# Altium schematic sheet eso32schemtic.SchDoc (part 1 of 3)
size A2; SheetNumber: 1; SheetTotal: 1
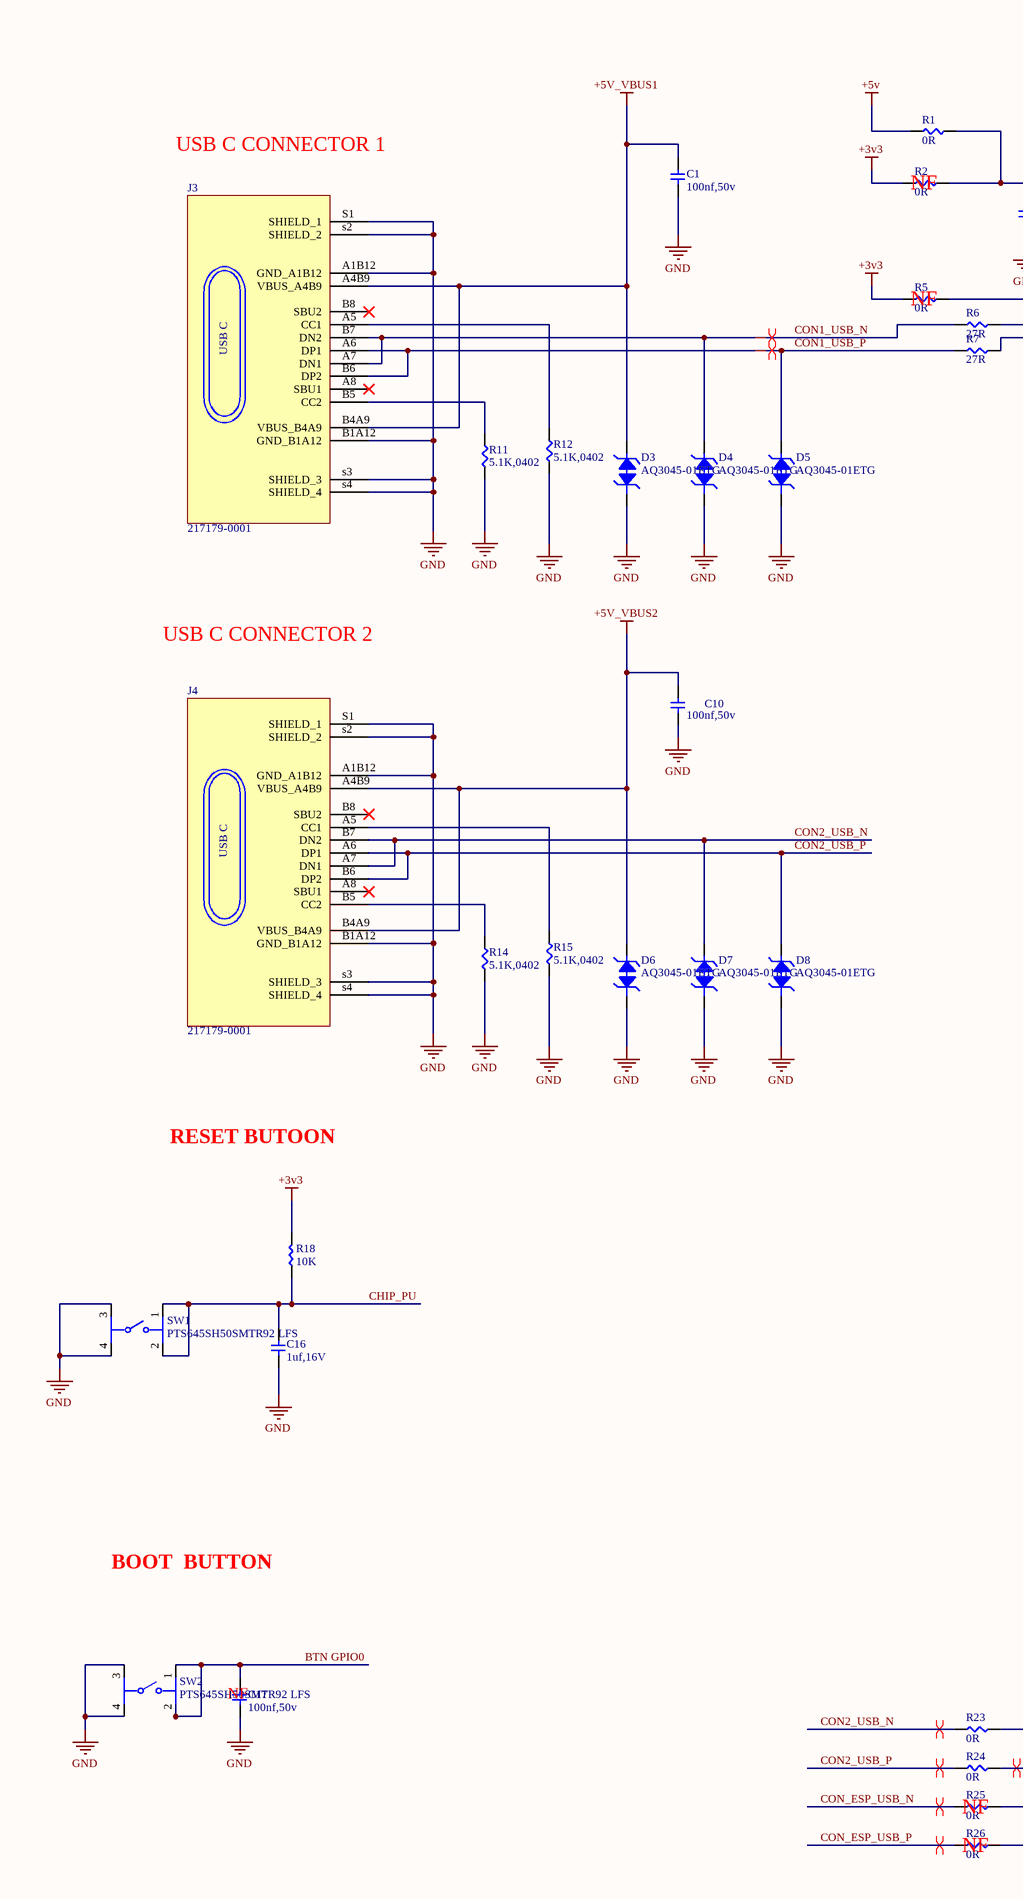
[diagram p0: eso32schemtic.SchDoc, left]
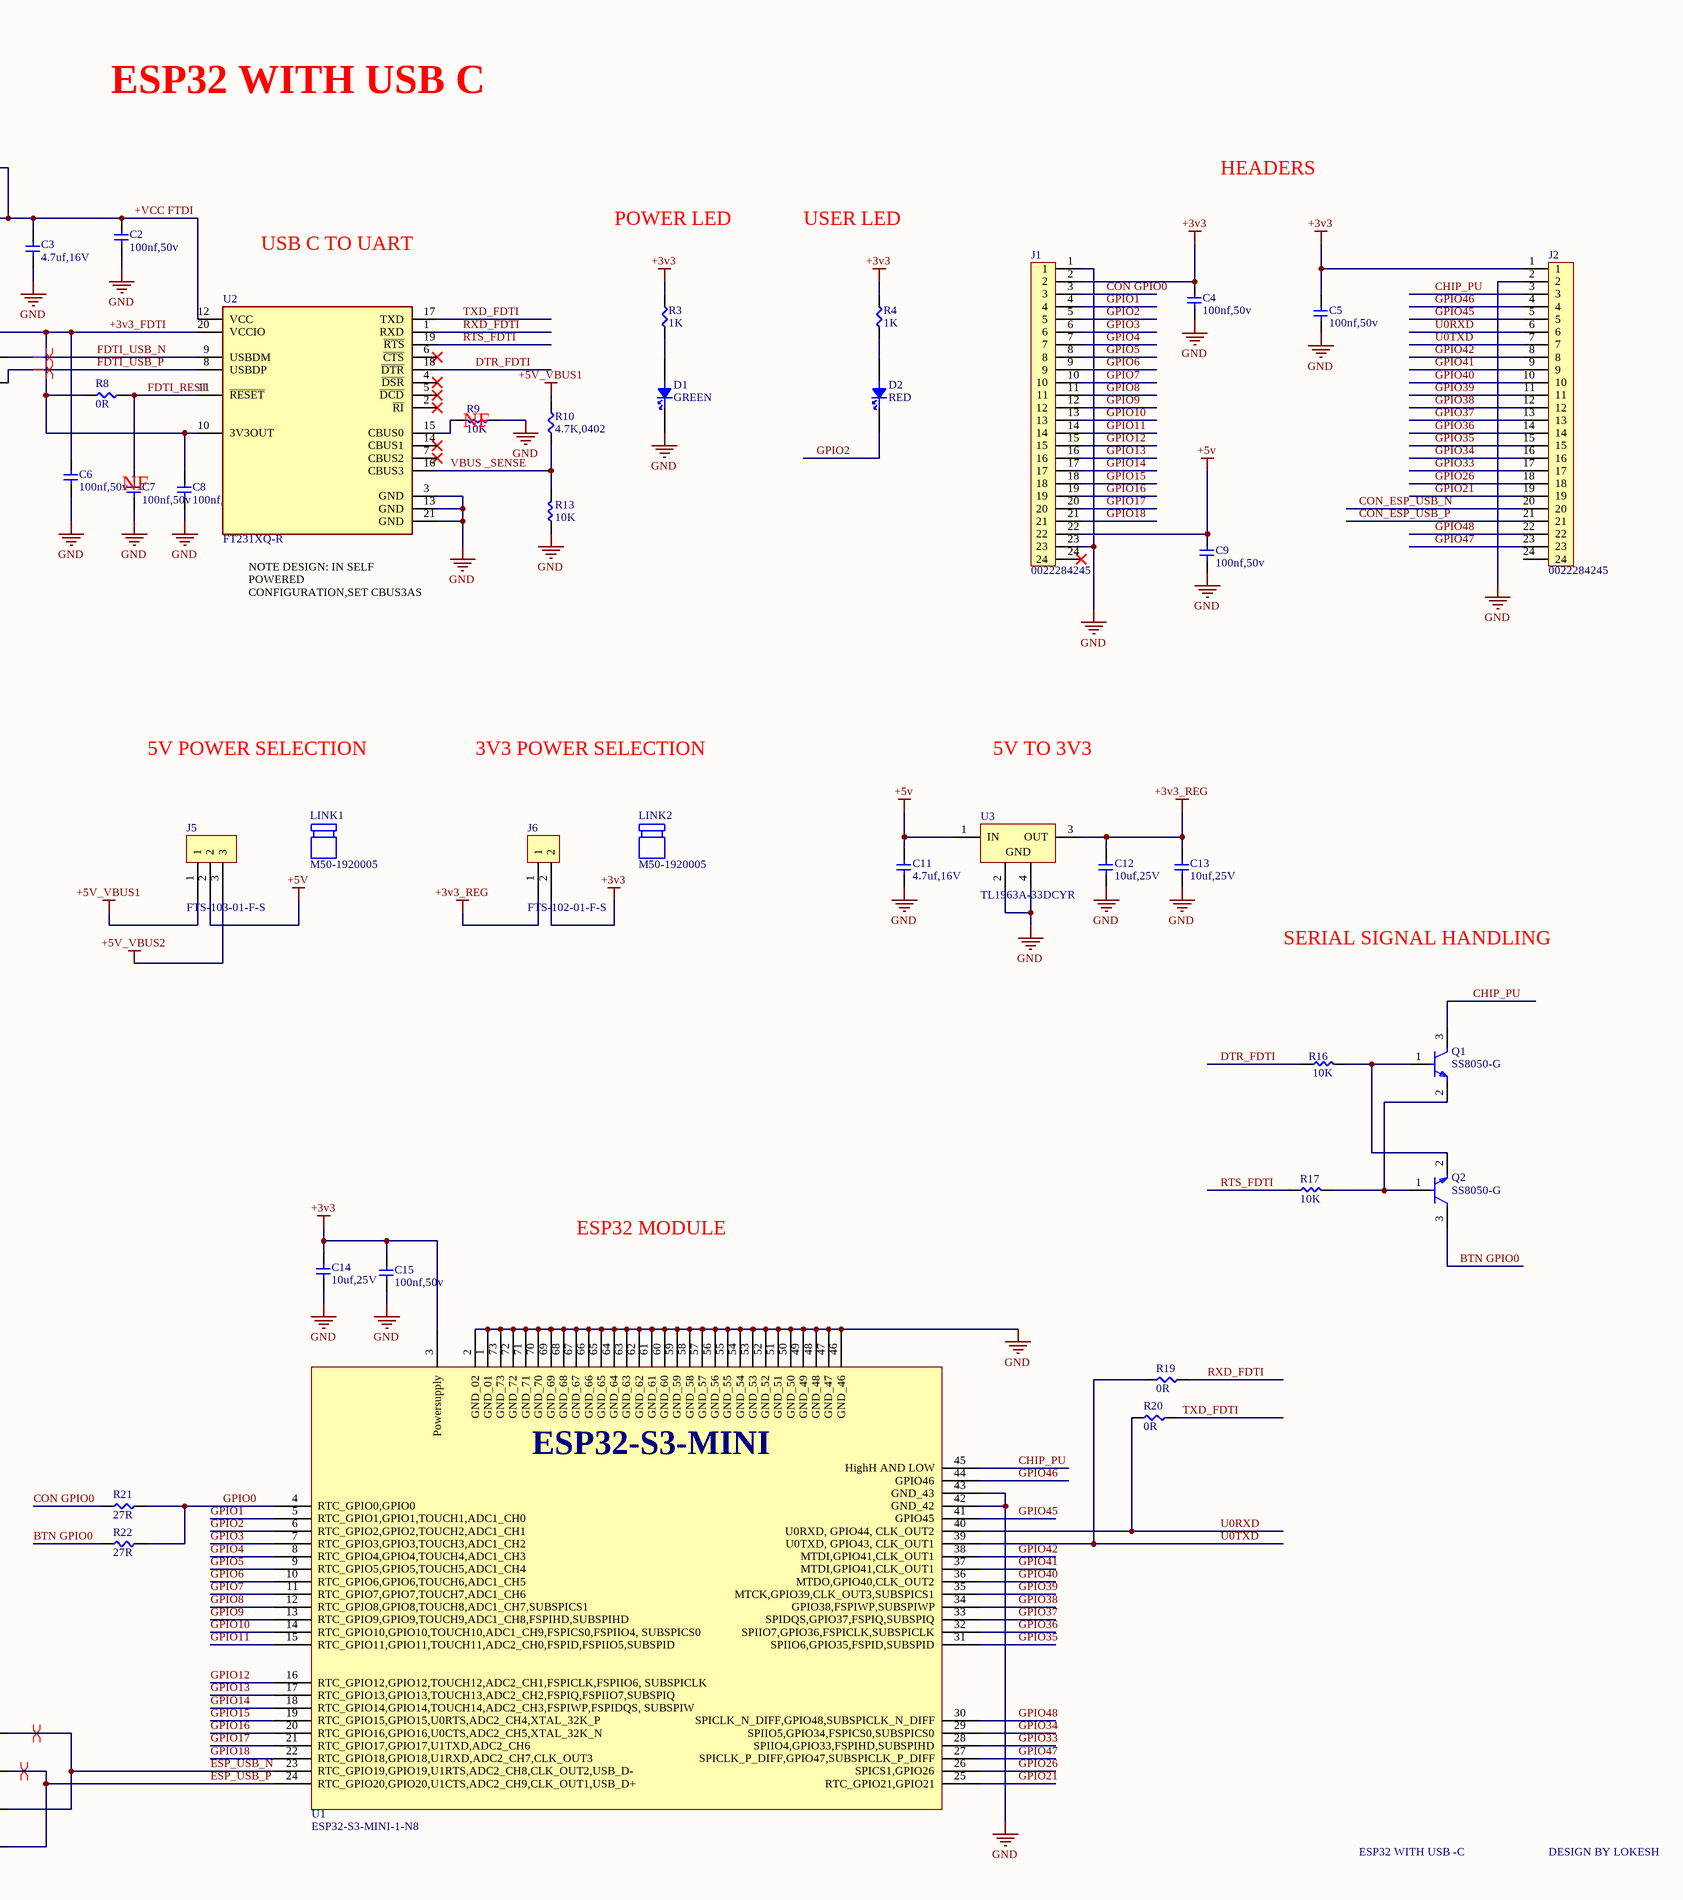
[diagram p1: eso32schemtic.SchDoc, right]

## Parts
C1  100nf,50v  [CAPC1005X65N]
C2  100nf,50v  [CAPC1005X65N]
C3  4.7uf,16V  [CAPC1005X65N]
C4  100nf,50v  [CAPC1005X65N]
C5  100nf,50v  [CAPC1005X65N]
C6  100nf,50v  [CAPC1005X65N]
C7  100nf,50v  [CAPC1005X65N]
C8  100nf,50v  [CAPC1005X65N]
C9  100nf,50v  [CAPC1005X65N]
C10  100nf,50v  [CAPC1005X65N]
C11  4.7uf,16V  [CAPC1005X65N]
C12  10uf,25V  [CAPC1005X65N]
C13  10uf,25V  [CAPC1005X65N]
C14  10uf,25V  [CAPC1005X65N]
C15  100nf,50v  [CAPC1005X65N]
C16  1uf,16V  [CAPC1005X65N]
C17  100nf,50v  [CAPC1005X65N]
D1  GREEN  [LED0402green]
D2  RED  [LED0402red]
D3  AQ3045-01ETG  [SOD882]
D4  AQ3045-01ETG  [SOD882]
D5  AQ3045-01ETG  [SOD882]
D6  AQ3045-01ETG  [SOD882]
D7  AQ3045-01ETG  [SOD882]
D8  AQ3045-01ETG  [SOD882]
J1  0022284245  [HDR_1x24_2.54MM]
J2  0022284245  [HDR_1x24_2.54MM]
J3  217179-0001  [FP-2171790001-MFG]
J4  217179-0001  [FP-2171790001-MFG]
J5  FTS-103-01-F-S  [HDR_1X3_1.27MM]
J6  FTS-102-01-F-S  [HDR_1X2_1.27MM - duplicate]
LINK1  M50-1920005  (mechanical)
LINK2  M50-1920005  (mechanical)
Q1  SS8050-G  [FP-SS8050-G-IPC_B]
Q2  SS8050-G  [FP-SS8050-G-IPC_B]
R1  0R  [RESC1005X37N]
R2  0R  [RESC1005X37N]
R3  1K  [RESC1005X37N]
R4  1K  [RESC1005X37N]
R5  0R  [RESC1005X37N]
R6  27R  [RESC1005X37N]
R7  27R  [RESC1005X37N]
R8  0R  [RESC1005X37N]
R9  10K  [RESC1005X37N]
R10  4.7K,0402  [RESC1005X37N]
R11  5.1K,0402  [RESC1005X37N]
R12  5.1K,0402  [RESC1005X37N]
R13  10K  [RESC1005X37N]
R14  5.1K,0402  [RESC1005X37N]
R15  5.1K,0402  [RESC1005X37N]
R16  10K  [RESC1005X37N]
R17  10K  [RESC1005X37N]
R18  10K  [RESC1005X37N]
R19  0R  [RESC1005X37N]
R20  0R  [RESC1005X37N]
R21  27R  [RESC1005X37N]
R22  27R  [RESC1005X37N]
R23  0R  [RESC1005X37N]
R24  0R  [RESC1005X37N]
R25  0R  [RESC1005X37N]
R26  0R  [RESC1005X37N]
SW1  PTS645SH50SMTR92 LFS  [FP-PTS645SH50SMTR92LFS]
SW2  PTS645SH50SMTR92 LFS  [FP-PTS645SH50SMTR92LFS]
U1  ESP32-S3-MINI-1-N8  [XCVR_ESP32-S3-MINI-1-N8]
U2  FT231XQ-R  [FP-QFN-20-IPC_B]
U3  TL1963A-33DCYR  [DCY0004A_N]

## Nets
+3v3: C4.2 C5.2 C14.2 C15.2 J1.2 J2.1 J6.2 R2.1 R3.2 R4.2 R5.1 R18.2 U1.3(Powersupply)
+3v3_REG: C12.2 C13.2 J6.1 U3.3(OUT)
+5V: C9.2 C11.2 J1.22 J5.2 R1.1 U3.1(IN)
+5V_VBUS1: C1.2 D3.2 J3.A4B9(VBUS_A4B9) J3.B4A9(VBUS_B4A9) J5.1 R10.2
+5V_VBUS2: C10.2 D6.2 J4.A4B9(VBUS_A4B9) J4.B4A9(VBUS_B4A9) J5.3
GND: C1.1 C2.1 C3.1 C4.1 C5.1 C6.1 C7.1 C8.1 C9.1 C10.1 C11.1 C12.1 C13.1 C14.1 C15.1 C16.1 C17.1 D1.1 D3.1 D4.1 D5.1 D6.1 D7.1 D8.1 J1.1 J1.23 J2.2 J3.A1B12(GND_A1B12) J3.B1A12(GND_B1A12) J3.S1(SHIELD_1) J3.s2(SHIELD_2) J3.s3(SHIELD_3) J3.s4(SHIELD_4) J4.A1B12(GND_A1B12) J4.B1A12(GND_B1A12) J4.S1(SHIELD_1) J4.s2(SHIELD_2) J4.s3(SHIELD_3) J4.s4(SHIELD_4) R9.1 R11.1 R12.1 R13.1 R14.1 R15.1 SW1.3 SW1.4 SW2.3 SW2.4 U1.1(GND_01) U1.2(GND_02) U1.42(GND_42) U1.43(GND_43) U1.46(GND_46) U1.47(GND_47) U1.48(GND_48) U1.49(GND_49) U1.50(GND_50) U1.51(GND_51) U1.52(GND_52) U1.53(GND_53) U1.54(GND_54) U1.55(GND_55) U1.56(GND_56) U1.57(GND_57) U1.58(GND_58) U1.59(GND_59) U1.60(GND_60) U1.61(GND_61) U1.62(GND_62) U1.63(GND_63) U1.64(GND_64) U1.65(GND_65) U1.66(GND_66) U1.67(GND_67) U1.68(GND_68) U1.69(GND_69) U1.70(GND_70) U1.71(GND_71) U1.72(GND_72) U1.73(GND_73) U2.3(GND) U2.13(GND) U2.21(GND) U3.2(GND) U3.4(GND)
+3v3_FDTI: C6.2 C8.2 R5.2 R8.1 U2.10(3V3OUT) U2.20(VCCIO)
+VCC FTDI: C2.2 C3.2 R1.2 R2.2 U2.12(VCC)
BTN GPIO0: C17.2 Q2.3(C) R22.1 SW2.1 SW2.2
CHIP_PU: C16.2 J2.3 Q1.3(C) R18.1 SW1.1 SW1.2 U1.45(HighH_AND_LOW)
CON1_USB_N: D4.2 J3.A7(DN1) J3.B7(DN2) R6.1
CON1_USB_P: D5.2 J3.A6(DP1) J3.B6(DP2) R7.1
CON2_USB_N: D7.2 J4.A7(DN1) J4.B7(DN2) R23.1
CON2_USB_P: D8.2 J4.A6(DP1) J4.B6(DP2) R24.1
CON GPIO0: J1.3 R21.1
CON_ESP_USB_N: J2.20 R25.1
CON_ESP_USB_P: J2.21 R26.1
DTR_FDTI: R16.1 U2.18(~{DTR})
ESP_USB_N: R23.2 R25.2 U1.23(RTC_GPIO19,GPIO19,U1RTS,ADC2_CH8,CLK_OUT2,USB_D-)
ESP_USB_P: R24.2 R26.2 U1.24(RTC_GPIO20,GPIO20,U1CTS,ADC2_CH9,CLK_OUT1,USB_D+)
FDTI_REST: C7.2 R8.2 U2.11(~{RESET})
FDTI_USB_N: R6.2 U2.9(USBDM)
FDTI_USB_P: R7.2 U2.8(USBDP)
GPIO0: R21.2 R22.2 U1.4(RTC_GPIO0,GPIO0)
GPIO1: J1.4 U1.5(RTC_GPIO1,GPIO1,TOUCH1,ADC1_CH0)
GPIO2: D2.1 J1.5 U1.6(RTC_GPIO2,GPIO2,TOUCH2,ADC1_CH1)
GPIO3: J1.6 U1.7(RTC_GPIO3,GPIO3,TOUCH3,ADC1_CH2)
GPIO4: J1.7 U1.8(RTC_GPIO4,GPIO4,TOUCH4,ADC1_CH3)
GPIO5: J1.8 U1.9(RTC_GPIO5,GPIO5,TOUCH5,ADC1_CH4)
GPIO6: J1.9 U1.10(RTC_GPIO6,GPIO6,TOUCH6,ADC1_CH5)
GPIO7: J1.10 U1.11(RTC_GPIO7,GPIO7,TOUCH7,ADC1_CH6)
GPIO8: J1.11 U1.12(RTC_GPIO8,GPIO8,TOUCH8,ADC1_CH7,SUBSPICS1)
GPIO9: J1.12 U1.13(RTC_GPIO9,GPIO9,TOUCH9,ADC1_CH8,FSPIHD,SUBSPIHD)
GPIO10: J1.13 U1.14(RTC_GPIO10,GPIO10,TOUCH10,ADC1_CH9,FSPICS0,FSPIIO4,_SUBSPICS0)
GPIO11: J1.14 U1.15(RTC_GPIO11,GPIO11,TOUCH11,ADC2_CH0,FSPID,FSPIIO5,SUBSPID)
GPIO12: J1.15 U1.16(RTC_GPIO12,GPIO12,TOUCH12,ADC2_CH1,FSPICLK,FSPIIO6,_SUBSPICLK)
GPIO13: J1.16 U1.17(RTC_GPIO13,GPIO13,TOUCH13,ADC2_CH2,FSPIQ,FSPIIO7,SUBSPIQ)
GPIO14: J1.17 U1.18(RTC_GPIO14,GPIO14,TOUCH14,ADC2_CH3,FSPIWP,FSPIDQS,_SUBSPIW)
GPIO15: J1.18 U1.19(RTC_GPIO15,GPIO15,U0RTS,ADC2_CH4,XTAL_32K_P)
GPIO16: J1.19 U1.20(RTC_GPIO16,GPIO16,U0CTS,ADC2_CH5,XTAL_32K_N)
GPIO17: J1.20 U1.21(RTC_GPIO17,GPIO17,U1TXD,ADC2_CH6)
GPIO18: J1.21 U1.22(RTC_GPIO18,GPIO18,U1RXD,ADC2_CH7,CLK_OUT3)
GPIO21: J2.19 U1.25(RTC_GPIO21,GPIO21)
GPIO26: J2.18 U1.26(SPICS1,GPIO26)
GPIO33: J2.17 U1.28(SPIIO4,GPIO33,FSPIHD,SUBSPIHD)
GPIO34: J2.16 U1.29(SPIIO5,GPIO34,FSPICS0,SUBSPICS0)
GPIO35: J2.15 U1.31(SPIIO6,GPIO35,FSPID,SUBSPID)
GPIO36: J2.14 U1.32(SPIIO7,GPIO36,FSPICLK,SUBSPICLK)
GPIO37: J2.13 U1.33(SPIDQS,GPIO37,FSPIQ,SUBSPIQ)
GPIO38: J2.12 U1.34(GPIO38,FSPIWP,SUBSPIWP)
GPIO39: J2.11 U1.35(MTCK,GPIO39,CLK_OUT3,SUBSPICS1)
GPIO40: J2.10 U1.36(MTDO,GPIO40,CLK_OUT2)
GPIO41: J2.9 U1.37(MTDI,GPIO41,CLK_OUT1)
GPIO42: J2.8 U1.38(MTDI,GPIO41,CLK_OUT1)
GPIO45: J2.5 U1.41(GPIO45)
GPIO46: J2.4 U1.44(GPIO46)
GPIO47: J2.23 U1.27(SPICLK_P_DIFF,GPIO47,SUBSPICLK_P_DIFF)
GPIO48: J2.22 U1.30(SPICLK_N_DIFF,GPIO48,SUBSPICLK_N_DIFF)
RTS_FDTI: R17.1 U2.19(~{RTS})
RXD_FDTI: R19.2 U2.1(RXD)
TXD_FDTI: R20.2 U2.17(TXD)
U0RXD: J2.6 R20.1 U1.40(U0RXD,_GPIO44,_CLK_OUT2)
U0TXD: J2.7 R19.1 U1.39(U0TXD,_GPIO43,_CLK_OUT1)
VBUS _SENSE: R10.1 R13.2 U2.16(CBUS3)
NetD1_2: D1.2 R3.1
NetD2_2: D2.2 R4.1
NetJ3_A5: J3.A5(CC1) R12.2
NetJ3_B5: J3.B5(CC2) R11.2
NetJ4_A5: J4.A5(CC1) R15.2
NetJ4_B5: J4.B5(CC2) R14.2
NetQ1_1: Q1.1(B) Q2.2(E) R16.2
NetQ1_2: Q1.2(E) Q2.1(B) R17.2
NetR9_2: R9.2 U2.15(CBUS0)

Not connected (* = marked no-connect by the designer): J1 24*; J2 24; J3 A8(SBU1)* B8(SBU2)*; J4 A8(SBU1)* B8(SBU2)*; U2 2(~{RI})* 4(~{DSR})* 5(~{DCD})* 6(~{CTS})* 7(CBUS2)* 14(CBUS1)*

## Layout directives
differential pair: CON1_USB_N, CON1_USB_P, CON2_USB_N, CON2_USB_P, CON_ESP_USB_N, CON_ESP_USB_P, ESP_USB_N, ESP_USB_P, FDTI_USB_N, FDTI_USB_P

## Notes on the sheet
- ESP32 WITH USB C
- HEADERS
- USB C CONNECTOR 1
- (near R2) NF
- POWER LED
- USER LED
- USB C TO UART
- (near R5) NF
- (near R9) NF
- (near C7) NF
- (near U2) NOTE DESIGN: IN SELF POWERED CONFIGURATION,SET CBUS3AS VBU_SENSE
- USB C CONNECTOR 2
- 5V POWER SELECTION
- 3V3 POWER SELECTION
- 5V TO 3V3
- SERIAL SIGNAL HANDLING
- RESET BUTOON
- ESP32 MODULE
- BOOT  BUTTON
- (near C17) NF
- (near R25) NF
- (near R26) NF
- ESP32 WITH USB -C
- DESIGN BY LOKESH
- (in symbol 217179-0001) USB C
- (in symbol ESP32-S3-MINI-1-N8) ESP32-S3-MINI